# EasyEDA Pro project H7MS-compact-before-pcb-20261017.epro, board H7MS_CORE_H735_A1_核心板PCB
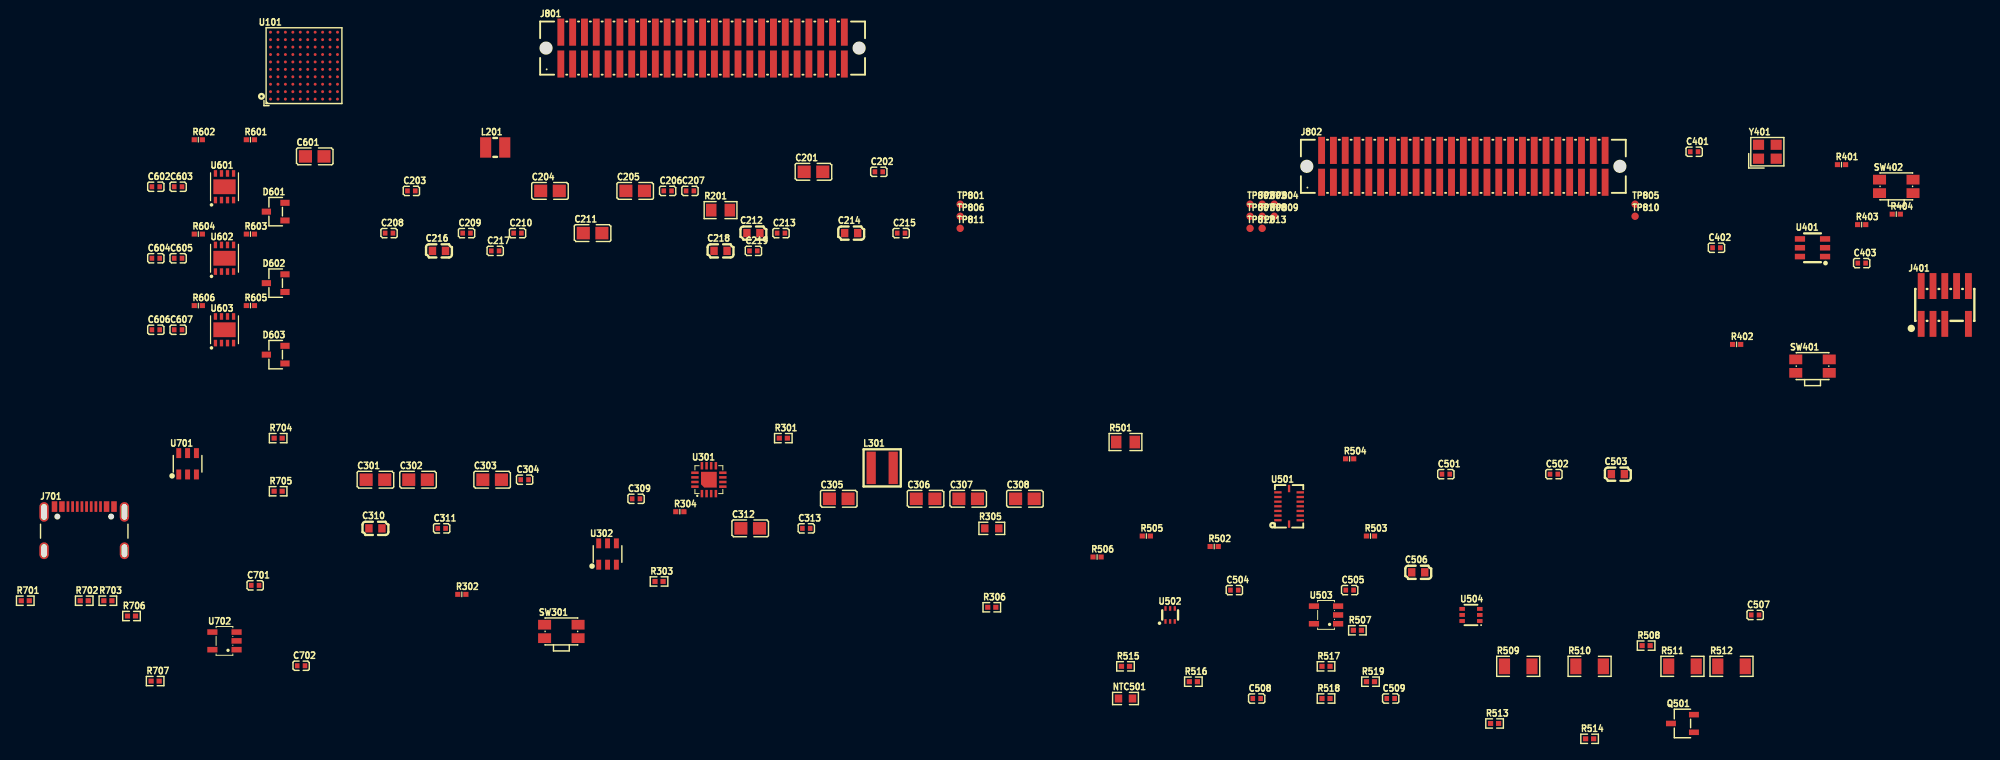
[diagram p8: board, top side]
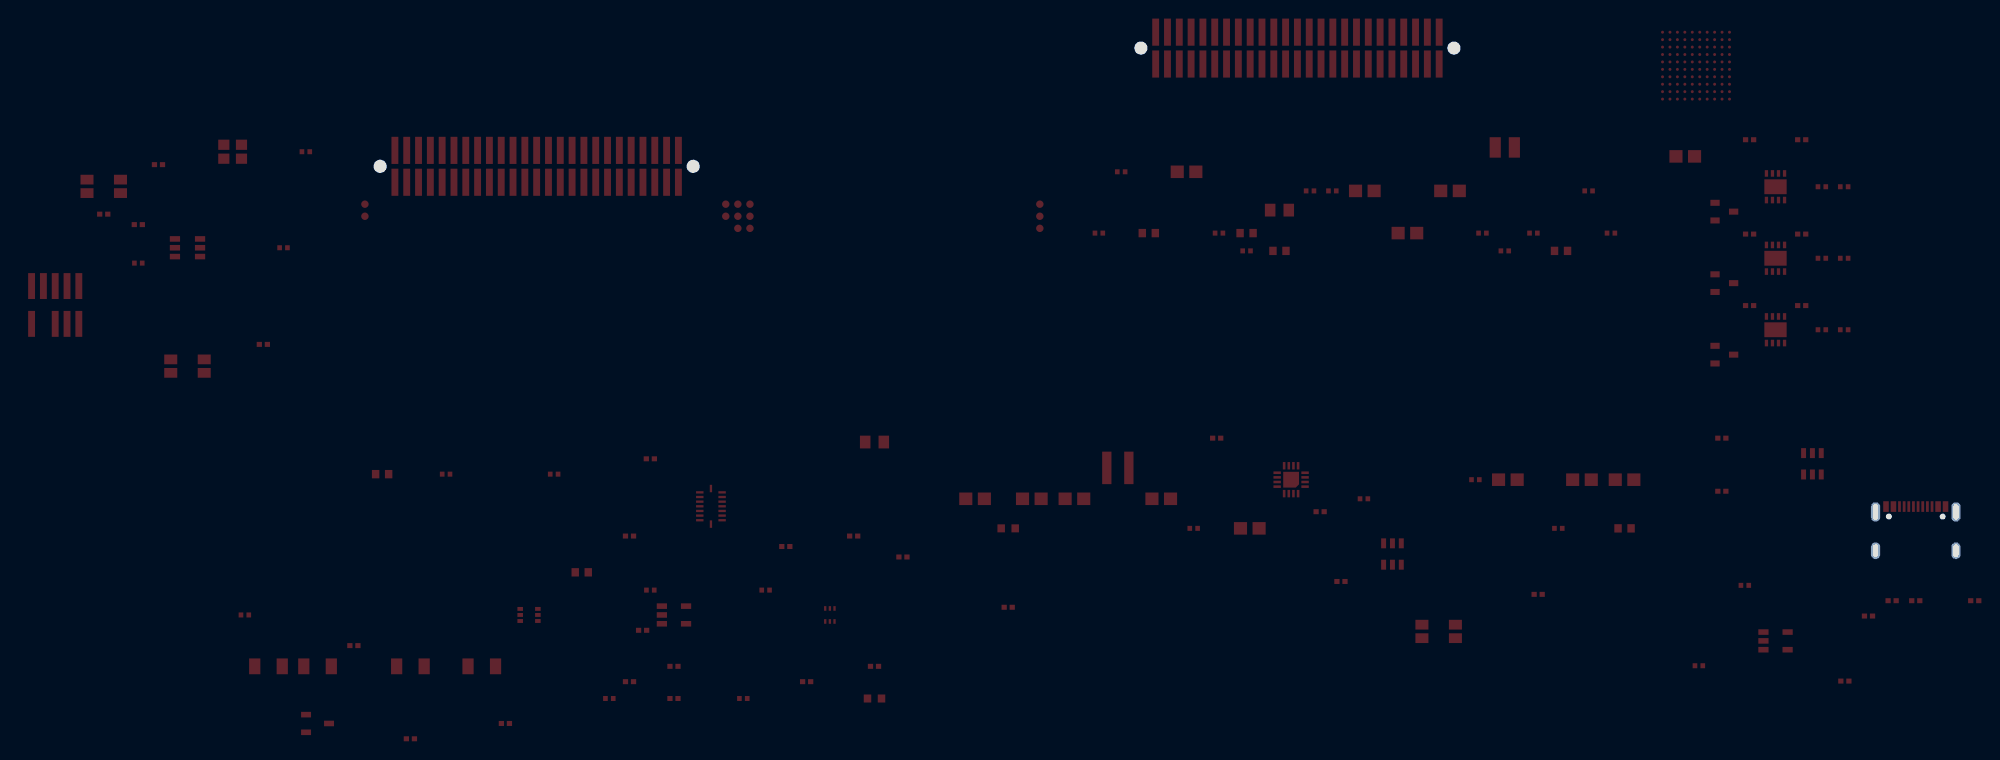
[diagram p9: board, bottom side, seen from below]

Outline 169.02 x 51.45 mm; copper layers: Top Layer, Bottom Layer. Coordinates in mm from the lower left corner of the outline.
Stack: Top Layer 0.035mm / Dielectric1 1.51mm FR4 er 4.5 / Bottom Layer 0.035mm

## Design rules (mm)
spacing copperThickness1oz (default): track to track 0.102, other pairs 0.152 to 0.3
spacing copperThickness2oz: track to track 0.203, other pairs 0.152 to 0.3
track width copperThickness1oz (default): min 0.127, default 0.254, max 2.54
track width copperThickness2oz: min 0.203, default 0.254, max 2.54
differential pair differentialPair (default): width min 0.127, default 0.254, max 2.54; gap min 0.152, default 0.152

## Placement (name value [footprint] x y rotation side)
C201  10uF  [C0805]  81.61 37.43 0 top
C202  100nF  [C0402]  88.64 37.43 0 top
C203  220pF  [C0402]  38.38 35.37 0 top
C204  10uF  [C0805]  53.29 35.37 0 top
C205  10uF  [C0805]  62.44 35.37 0 top
C206  100nF  [C0402]  65.93 35.37 0 top
C207  100nF  [C0402]  68.33 35.37 0 top
C208  100nF  [C0402]  35.98 30.83 0 top
C209  100nF  [C0402]  44.32 30.83 0 top
C210  100nF  [C0402]  49.8 30.83 0 top
C211  10uF  [C0805]  57.87 30.83 0 top
C212  1uF  [C0603]  75.16 30.83 0 top
C213  100nF  [C0402]  78.12 30.83 0 top
C214  1uF  [C0603]  85.67 30.83 0 top
C215  100nF  [C0402]  91.04 30.83 0 top
C216  1uF  [C0603]  41.35 28.92 0 top
C217  100nF  [C0402]  47.4 28.92 0 top
C218  1uF  [C0603]  71.62 28.92 0 top
C219  100nF  [C0402]  75.16 28.92 0 top
C301  10uF  [C0805]  34.52 4.29 0 top
C302  10uF  [C0805]  39.1 4.29 0 top
C303  10uF  [C0805]  47.07 4.29 0 top
C304  100nF  [C0402]  50.56 4.29 0 top
C305  10uF  [C0805]  84.33 2.23 0 top
C306  10uF  [C0805]  93.67 2.23 0 top
C307  10uF  [C0805]  98.25 2.23 0 top
C308  10uF  [C0805]  104.35 2.23 0 top
C309  10nF  [C0402]  62.54 2.23 0 top
C310  1uF  [C0603]  34.52 -0.95 0 top
C311  100nF  [C0402]  41.64 -0.95 0 top
C312  10uF  [C0805]  74.81 -0.95 0 top
C313  100nF  [C0402]  80.84 -0.95 0 top
C401  100nF  [C0402]  176.3 39.59 0 top
C402  100nF  [C0402]  178.7 29.25 0 top
C403  100nF  [C0402]  194.31 27.6 0 top
C501  100nF  [C0402]  149.6 4.89 0 top
C502  100nF  [C0402]  161.22 4.89 0 top
C503  1uF  [C0603]  168.09 4.89 0 top
C504  100nF  [C0402]  126.86 -7.59 0 top
C505  100nF  [C0402]  139.26 -7.59 0 top
C506  1uF  [C0603]  146.63 -5.68 0 top
C507  100nF  [C0402]  182.85 -10.27 0 top
C508  10nF  [C0402]  129.26 -19.26 0 top
C509  10nF  [C0402]  143.67 -19.26 0 top
C601  10uF  [C0805]  27.99 39.09 0 top
C602  100nF  [C0402]  10.91 35.82 0 top
C603  100nF  [C0402]  13.31 35.82 0 top
C604  100nF  [C0402]  10.91 28.12 0 top
C605  100nF  [C0402]  13.31 28.12 0 top
C606  100nF  [C0402]  10.91 20.43 0 top
C607  100nF  [C0402]  13.31 20.43 0 top
C701  100nF  [C0402]  21.59 -7.08 0 top
C702  100nF  [C0402]  26.53 -15.73 0 top
D601  PESD2CANFD24V-TR  [SOT-23-3_L2.9-W1.3-P1.90-LS2.4-BR]  23.79 33.14 0 top
D602  PESD2CANFD24V-TR  [SOT-23-3_L2.9-W1.3-P1.90-LS2.4-BR]  23.79 25.44 0 top
D603  PESD2CANFD24V-TR  [SOT-23-3_L2.9-W1.3-P1.90-LS2.4-BR]  23.79 17.75 0 top
J401  FTSH-105-01-L-DV-007-K  [HDR-SMD_9P-P1.27_FTSH-105-01-L-DV-007-K]  203.24 23.1 0 top
J701  USB4105-GF-A-120  [H7MS_USB4105_GF_A_120_B4_R3]  3.21 1.4 0 top
J801  TFM-125-02-L-D-A  [CONN-SMD_50P-P1.27_TFM-125-02-L-D-A]  69.69 50.74 0 top
J802  TFM-125-02-L-D-A  [CONN-SMD_50P-P1.27_TFM-125-02-L-D-A]  151.48 38.02 0 top
L201  2.2uH  [IND-SMD_L2.5-W2.0-1]  47.4 40.05 0 top
L301  2.2uH  [IND-SMD_L4.0-W4.0_XAL4030-332MEC]  89 5.56 0 top
NTC501  NTCG163JF103FT1  [R0603]  115.16 -19.26 0 top
Q501  DMN2056U-7  [SOT-23-3_L2.9-W1.6-P1.90-LS2.8-BR]  175.04 -21.95 0 top
R201  0Ω  [R0805]  71.62 33.3 0 top
R301  100kΩ  [R0402]  78.37 8.76 0 top
R302  10kΩ  [R0402]  43.81 -8.05 0 top
R303  45.3kΩ  [R0402]  65.01 -6.66 0 top
R304  10kΩ  [R0402]  67.25 0.85 0 top
R305  312kΩ  [R0603]  100.79 -0.95 0 top
R306  100kΩ  [R0402]  100.79 -9.44 0 top
R401  22Ω  [R0402]  192.14 38.2 0 top
R402  10kΩ  [R0402]  180.86 18.85 0 top
R403  10kΩ  [R0402]  194.31 31.74 0 top
R404  10kΩ  [R0402]  198.02 32.87 0 top
R501  0Ω  [R0805]  115.16 8.34 0 top
R502  22Ω  [R0402]  124.69 -2.9 0 top
R503  22Ω  [R0402]  141.5 -1.78 0 top
R504  10kΩ  [R0402]  139.26 6.54 0 top
R505  10kΩ  [R0402]  117.4 -1.78 0 top
R506  10kΩ  [R0402]  112.1 -4.03 0 top
R507  100kΩ  [R0402]  140.09 -11.92 0 top
R508  1kΩ  [R0402]  171.13 -13.57 0 top
R509  200Ω  [R1206]  157.38 -15.8 0 top
R510  200Ω  [R1206]  165.06 -15.8 0 top
R511  200Ω  [R1206]  175.04 -15.8 0 top
R512  200Ω  [R1206]  180.31 -15.8 0 top
R513  100Ω  [R0402]  154.84 -21.95 0 top
R514  100kΩ  [R0402]  165.06 -23.6 0 top
R515  10kΩ  [R0402]  115.16 -15.8 0 top
R516  1kΩ  [R0402]  122.46 -17.45 0 top
R517  20kΩ  [R0402]  136.72 -15.8 0 top
R518  10kΩ  [R0402]  136.72 -19.26 0 top
R519  1kΩ  [R0402]  141.5 -17.45 0 top
R601  10kΩ  [R0402]  21.08 40.88 0 top
R602  10kΩ  [R0402]  15.47 40.88 0 top
R603  10kΩ  [R0402]  21.08 30.72 0 top
R604  10kΩ  [R0402]  15.47 30.72 0 top
R605  10kΩ  [R0402]  21.08 23.03 0 top
R606  10kΩ  [R0402]  15.47 23.03 0 top
R701  5.1kΩ  [R0402]  -3.13 -8.73 0 top
R702  5.1kΩ  [R0402]  3.21 -8.73 0 top
R703  0Ω  [R0402]  5.75 -8.73 0 top
R704  0Ω  [R0402]  24.06 8.76 0 top
R705  0Ω  [R0402]  24.06 3.05 0 top
R706  1kΩ  [R0402]  8.29 -10.38 0 top
R707  100kΩ  [R0402]  10.83 -17.39 0 top
SW301  EVQP7A01P  [H7MS_EVQP7A01P_1234]  54.51 -12.04 0 top
SW401  EVQP7A01P  [H7MS_EVQP7A01P_1234]  189.02 16.51 0 top
SW402  EVQP7A01P  [H7MS_EVQP7A01P_1234]  198.02 35.86 0 top
TP801  PCB_TP_0.8  [H7MS_TP_0p8_NOMASKPASTE]  97.39 33.94 0 top
TP802  PCB_TP_0.8  [H7MS_TP_0p8_NOMASKPASTE]  128.55 33.94 0 top
TP803  PCB_TP_0.8  [H7MS_TP_0p8_NOMASKPASTE]  129.85 33.94 0 top
TP804  PCB_TP_0.8  [H7MS_TP_0p8_NOMASKPASTE]  131.15 33.94 0 top
TP805  PCB_TP_0.8  [H7MS_TP_0p8_NOMASKPASTE]  169.95 33.94 0 top
TP806  PCB_TP_0.8  [H7MS_TP_0p8_NOMASKPASTE]  97.39 32.64 0 top
TP807  PCB_TP_0.8  [H7MS_TP_0p8_NOMASKPASTE]  128.55 32.64 0 top
TP808  PCB_TP_0.8  [H7MS_TP_0p8_NOMASKPASTE]  129.85 32.64 0 top
TP809  PCB_TP_0.8  [H7MS_TP_0p8_NOMASKPASTE]  131.15 32.64 0 top
TP810  PCB_TP_0.8  [H7MS_TP_0p8_NOMASKPASTE]  169.95 32.64 0 top
TP811  PCB_TP_0.8  [H7MS_TP_0p8_NOMASKPASTE]  97.39 31.34 0 top
TP812  PCB_TP_0.8  [H7MS_TP_0p8_NOMASKPASTE]  128.55 31.34 0 top
TP813  PCB_TP_0.8  [H7MS_TP_0p8_NOMASKPASTE]  129.85 31.34 0 top
U101  STM32H735VGH6  [BGA-100_L8.0-W8.0-P0.80-R10-C10-BL]  26.84 48.85 0 top
U301  TPS62130ARGTR  [VQFN-16_L3.0-W3.0-P0.50-BL-EP1.7]  70.37 4.29 0 top
U302  TPS2553DBVR-1  [SOT-23-6_L2.9-W1.6-P0.95-LS2.8-BL]  59.47 -3.71 0 top
U401  TPS3808G33DBVR  [SOT-23-6_L2.9-W1.6-P0.95-LS2.8-BR]  189.02 29.25 0 top
U501  BMI088  [LGA-16_L4.5-W3.0-P0.50-BL]  132.74 1.42 0 top
U502  TMP302ADRLR  [SOT-5X3-6_W1.6-L1.2-P0.50-LS1.6-BL]  119.96 -10.27 0 top
U503  SN74LVC1G08DBVR  [SOT-23-5_L3.0-W1.7-P0.95-LS2.8-BR]  136.72 -10.27 0 top
U504  TPS22919DCKR  [SC-70-6_L2.2-W1.3-P0.65-LS2.1-BR]  152.3 -10.27 0 top
U601  TCAN1042HGVDRBRQ1  [HVSON-8_L3.0-W3.0-P0.65-BL-EP]  18.29 35.82 0 top
U602  TCAN1042HGVDRBRQ1  [HVSON-8_L3.0-W3.0-P0.65-BL-EP]  18.29 28.12 0 top
U603  TCAN1042HGVDRBRQ1  [HVSON-8_L3.0-W3.0-P0.65-BL-EP]  18.29 20.43 0 top
U701  USBLC6-2SC6  [SOT-23-6_L2.9-W1.6-P0.95-LS2.8-BL]  14.32 6 0 top
U702  SN74LVC1G17DBVR  [SOT-23-5_L3.0-W1.7-P0.95-LS2.8-BR]  18.29 -13.06 0 top
Y401  X1G0041710015  [OSC-SMD_4P-L2.5-W2.0-BL]  184.17 39.59 0 top

## Footprints (pads in the part's own frame, mm; a bottom-side part is the same pattern mirrored in y, then rotated)
BGA-100_L8.0-W8.0-P0.80-R10-C10-BL
  round 0.32 smd: A1(-3.6,-3.6) A2(-3.6,-2.8) A3(-3.6,-2) A4(-3.6,-1.2) A5(-3.6,-0.4) A6(-3.6,0.4) A7(-3.6,1.2) A8(-3.6,2) A9(-3.6,2.8) A10(-3.6,3.6) B1(-2.8,-3.6) B2(-2.8,-2.8) B3(-2.8,-2) B4(-2.8,-1.2) B5(-2.8,-0.4) B6(-2.8,0.4) B7(-2.8,1.2) B8(-2.8,2) B9(-2.8,2.8) B10(-2.8,3.6) C1(-2,-3.6) C2(-2,-2.8) C3(-2,-2) C4(-2,-1.2) C5(-2,-0.4) C6(-2,0.4) C7(-2,1.2) C8(-2,2) C9(-2,2.8) C10(-2,3.6) D1(-1.2,-3.6) D2(-1.2,-2.8) D3(-1.2,-2) D4(-1.2,-1.2) D5(-1.2,-0.4) D6(-1.2,0.4) D7(-1.2,1.2) D8(-1.2,2) D9(-1.2,2.8) D10(-1.2,3.6) E1(-0.4,-3.6) E2(-0.4,-2.8) E3(-0.4,-2) E4(-0.4,-1.2) E5(-0.4,-0.4) E6(-0.4,0.4) E7(-0.4,1.2) E8(-0.4,2) E9(-0.4,2.8) E10(-0.4,3.6) F1(0.4,-3.6) F2(0.4,-2.8) F3(0.4,-2) F4(0.4,-1.2) F5(0.4,-0.4) F6(0.4,0.4) F7(0.4,1.2) F8(0.4,2) F9(0.4,2.8) F10(0.4,3.6) G1(1.2,-3.6) G2(1.2,-2.8) G3(1.2,-2) G4(1.2,-1.2) G5(1.2,-0.4) G6(1.2,0.4) G7(1.2,1.2) G8(1.2,2) G9(1.2,2.8) G10(1.2,3.6) H1(2,-3.6) H2(2,-2.8) H3(2,-2) H4(2,-1.2) H5(2,-0.4) H6(2,0.4) H7(2,1.2) H8(2,2) H9(2,2.8) H10(2,3.6) J1(2.8,-3.6) J2(2.8,-2.8) J3(2.8,-2) J4(2.8,-1.2) J5(2.8,-0.4) J6(2.8,0.4) J7(2.8,1.2) J8(2.8,2) J9(2.8,2.8) J10(2.8,3.6) K1(3.6,-3.6) K2(3.6,-2.8) K3(3.6,-2) K4(3.6,-1.2) K5(3.6,-0.4) K6(3.6,0.4) K7(3.6,1.2) K8(3.6,2) K9(3.6,2.8) K10(3.6,3.6)
C0402
  rect 0.5x0.54 smd: 1(-0.42,0) 2(0.42,0)
C0603
  rect 0.8x0.9 smd: 1(-0.7,0) 2(0.7,0)
C0805
  rect 1.41x1.35 smd: 1(-1,0) 2(1,0)
CONN-SMD_50P-P1.27_TFM-125-02-L-D-A
  rect 0.74x2.92 smd: 1(-15.24,-1.715) 2(-15.24,1.715) 3(-13.97,-1.715) 4(-13.97,1.715) 5(-12.7,-1.715) 6(-12.7,1.715) 7(-11.43,-1.715) 8(-11.43,1.715) 9(-10.16,-1.715) 10(-10.16,1.715) 11(-8.89,-1.715) 12(-8.89,1.715) 13(-7.62,-1.715) 14(-7.62,1.715) 15(-6.35,-1.715) 16(-6.35,1.715) 17(-5.08,-1.715) 18(-5.08,1.715) 19(-3.81,-1.715) 20(-3.81,1.715) 21(-2.54,-1.715) 22(-2.54,1.715) 23(-1.27,-1.715) 24(-1.27,1.715) 25(0,-1.715) 26(0,1.715) 27(1.27,-1.715) 28(1.27,1.715) 29(2.54,-1.715) 30(2.54,1.715) 31(3.81,-1.715) 32(3.81,1.715) 33(5.08,-1.715) 34(5.08,1.715) 35(6.35,-1.715) 36(6.35,1.715) 37(7.62,-1.715) 38(7.62,1.715) 39(8.89,-1.715) 40(8.89,1.715) 41(10.16,-1.715) 42(10.16,1.715) 43(11.43,-1.715) 44(11.43,1.715) 45(12.7,-1.715) 46(12.7,1.715) 47(13.97,-1.715) 48(13.97,1.715) 49(15.24,-1.715) 50(15.24,1.715)
H7MS_EVQP7A01P_1234
  rect 1.4x1.05 smd: 1(-1.8,0.725) 2(-1.8,-0.725) 3(1.8,0.725) 4(1.8,-0.725)
H7MS_TP_0p8_NOMASKPASTE
  round 0.8 smd: 1(0,0)
H7MS_USB4105_GF_A_120_B4_R3
  oval 1x2.1 hole 0.6x1.7: 1(-4.32,-0.575) 4(4.32,-0.575)
  oval 1x1.8 hole 0.6x1.4: 2(-4.32,-4.755) 3(4.32,-4.755)
  rect 0.6x1.15 smd: A1-B12(-3.2,0) A4-B9(-2.4,0) B1-A12(3.2,0) B4-A9(2.4,0)
  rect 0.3x1.15 smd: A5(-1.25,0) A6(-0.25,0) A7(0.25,0) A8(1.75,0) B5(1.25,0) B6(0.75,0) B7(-0.75,0) B8(-1.75,0)
HDR-SMD_9P-P1.27_FTSH-105-01-L-DV-007-K
  rect 0.74x2.79 smd: 1(-2.54,-2.035) 2(-2.54,2.035) 3(-1.27,-2.035) 4(-1.27,2.035) 5(0,-2.035) 6(0,2.035) 8(1.27,2.035) 9(2.54,-2.035) 10(2.54,2.035)
HVSON-8_L3.0-W3.0-P0.65-BL-EP
  rect 0.355x0.711 smd: 1(-0.975,-1.433) 2(-0.325,-1.433) 3(0.325,-1.433) 4(0.975,-1.433) 5(0.975,1.433) 6(0.325,1.433) 7(-0.325,1.433) 8(-0.975,1.433)
  rect 2.4x1.6 smd: 9(0,0)
IND-SMD_L2.5-W2.0-1
  rect 1.2x2.2 smd: 1(1.028,0) 2(-1.028,0)
IND-SMD_L4.0-W4.0_XAL4030-332MEC
  rect 1x3.5 smd: 1(-1.185,0) 2(1.185,0)
LGA-16_L4.5-W3.0-P0.50-BL
  rect 0.8x0.25 smd: 1(-1.2,-1.498) 2(-1.2,-0.998) 3(-1.2,-0.498) 4(-1.2,0.002) 5(-1.2,0.502) 6(-1.2,1.002) 7(-1.2,1.502) 9(1.2,1.502) 10(1.2,1.002) 11(1.2,0.502) 12(1.2,0.002) 13(1.2,-0.498) 14(1.2,-0.998) 15(1.2,-1.498)
  rect 0.25x0.8 smd: 8(0,1.915) 16(0,-1.915)
OSC-SMD_4P-L2.5-W2.0-BL
  rect 1.2x1.1 smd: 1(-0.95,-0.75) 2(0.95,-0.75) 3(0.95,0.75) 4(-0.95,0.75)
R0402
  rect 0.566x0.54 smd: 1(-0.433,0) 2(0.433,0)
R0603
  rect 0.806x0.864 smd: 1(-0.753,0) 2(0.753,0)
R0805
  rect 1.133x1.377 smd: 1(-1,0) 2(1,0)
R1206
  rect 1.208x1.701 smd: 1(-1.479,0) 2(1.479,0)
SC-70-6_L2.2-W1.3-P0.65-LS2.1-BR
  rect 0.6x0.42 smd: 1(0.95,-0.65) 2(0.95,0) 3(0.95,0.65) 4(-0.95,0.65) 5(-0.95,0) 6(-0.95,-0.65)
SOT-5X3-6_W1.6-L1.2-P0.50-LS1.6-BL
  rect 0.25x0.5 smd: 1(-0.501,-0.7) 2(-0.001,-0.7) 3(0.499,-0.7) 4(0.501,0.7) 5(-0.001,0.7) 6(-0.501,0.7)
SOT-23-3_L2.9-W1.3-P1.90-LS2.4-BR
  rect 1x0.65 smd: 1(1,-0.95) 2(1,0.95) 3(-1,0)
SOT-23-3_L2.9-W1.6-P1.90-LS2.8-BR
  rect 1.07x0.6 smd: 1(1.235,-0.95) 2(1.235,0.95) 3(-1.235,0)
SOT-23-5_L3.0-W1.7-P0.95-LS2.8-BR
  rect 1.1x0.6 smd: 1(1.3,-0.95) 2(1.3,0) 3(1.3,0.95) 4(-1.3,0.95) 5(-1.3,-0.95)
SOT-23-6_L2.9-W1.6-P0.95-LS2.8-BL
  rect 0.532x1.072 smd: 1(-0.95,-1.149) 2(0,-1.149) 3(0.95,-1.149) 4(0.95,1.149) 5(0,1.149) 6(-0.95,1.149)
SOT-23-6_L2.9-W1.6-P0.95-LS2.8-BR
  rect 1.1x0.6 smd: 1(1.35,-0.95) 2(1.35,0) 3(1.35,0.95) 4(-1.35,0.95) 5(-1.35,0) 6(-1.35,-0.95)
VQFN-16_L3.0-W3.0-P0.50-BL-EP1.7
  rect 0.28x0.8 smd: 1(-0.749,-1.5) 2(-0.249,-1.5) 3(0.249,-1.5) 4(0.75,-1.5) 9(0.75,1.5) 10(0.249,1.5) 11(-0.249,1.5) 12(-0.749,1.5)
  rect 0.8x0.28 smd: 5(1.5,-0.749) 6(1.5,-0.249) 7(1.5,0.249) 8(1.5,0.75) 13(-1.5,0.75) 14(-1.5,0.249) 15(-1.5,-0.249) 16(-1.5,-0.749)
  custom 1.7x1.7 smd: 17(0,0)

## Nets
As in the schematic.

Pads without a net: J401 6 8; J701 A8 B8; U101 B1 B2 G2; U401 4; U501 1 13; U504 4; U702 1
